# Altium schematic sheet RELE.SchDoc: ИЛ1429ТО1/1
size 410 x 297 mm; ApprovedBy: Стерхов В.Д.; CheckedBy: Стерхов В.Д.; Author: Сергеев Д.А.; CompanyName: ГК "СНАБЖЕНИЕ"; DrawnBy: Сергеев Д.А.; Engineer: Сергеев Д.А.; Organization: ГК "СНАБЖЕНИЕ"; DocumentNumber: ИЛ1429ТО1/1; Revision: 1; SheetNumber: 2; SheetTotal: 3
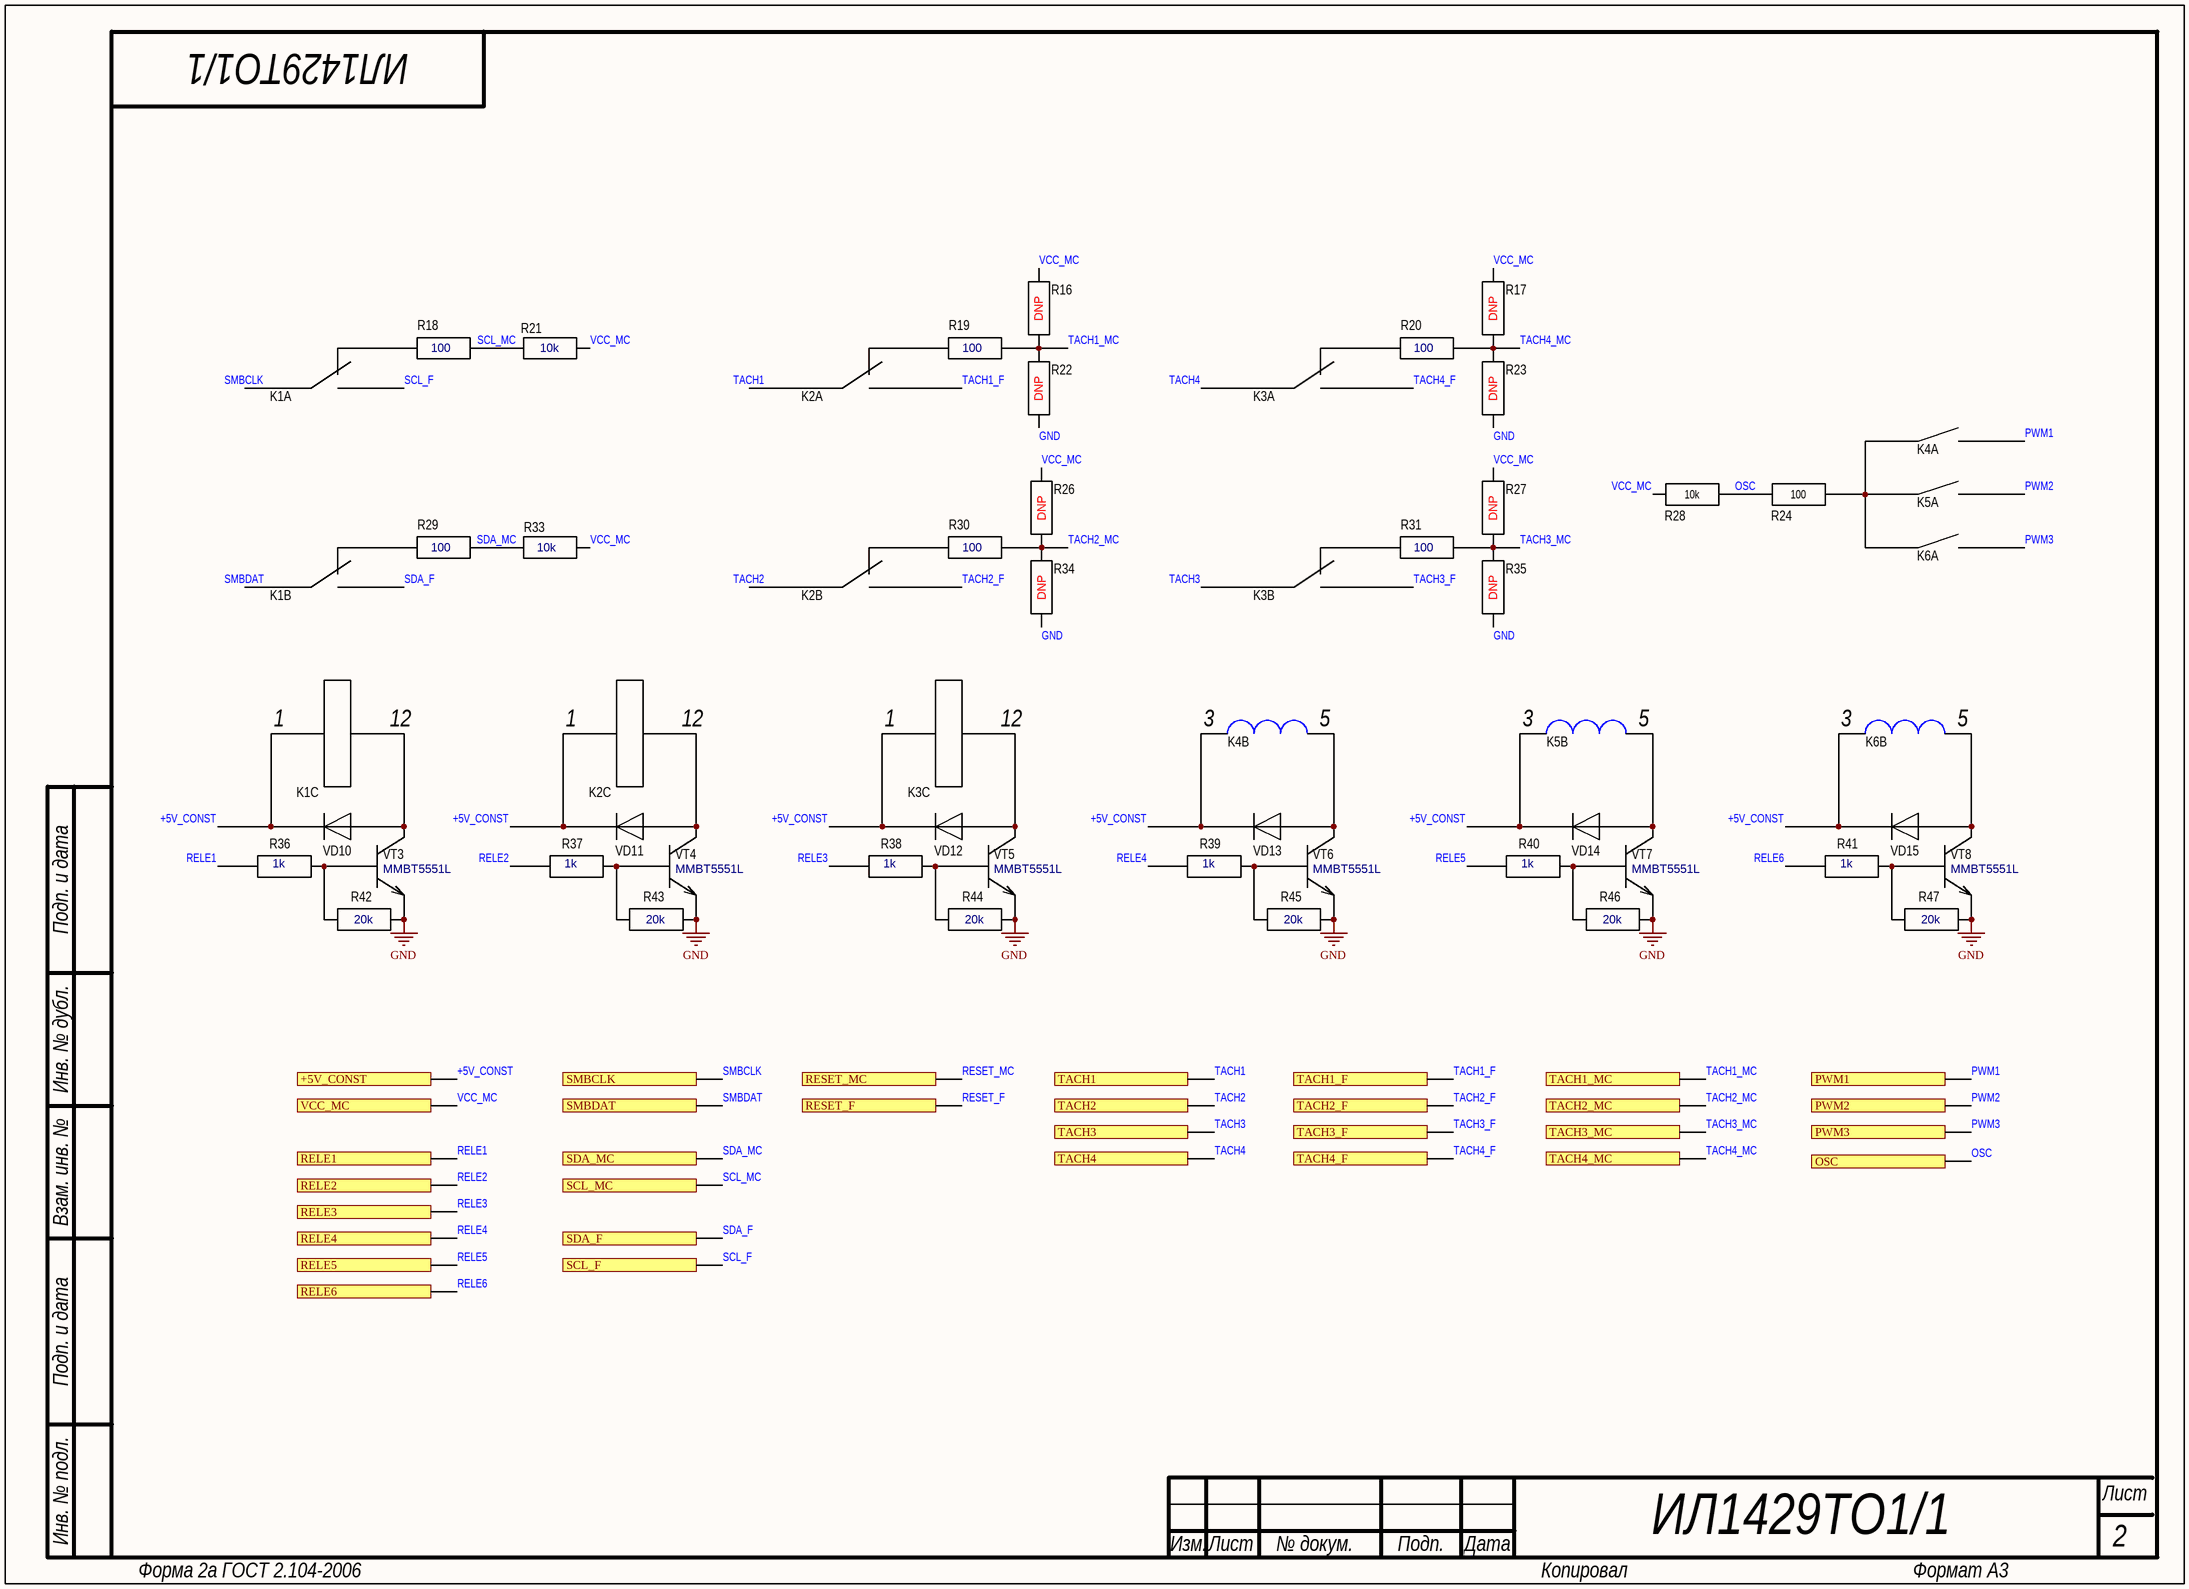
[diagram p0: RELE.SchDoc]

## Parts
K1  V23079A1001B301 TE  [V23079A1001B301]  (value not drawn)  (parts A,B,C of 3)
K2  V23079A1001B301 TE  [V23079A1001B301]  (value not drawn)  (parts A,B,C of 3)
K3  V23079A1001B301 TE  [V23079A1001B301]  (value not drawn)  (parts A,B,C of 3)
K4  TRR1A05F00  [TRR1A05F00]  (value not drawn)  (parts A,B of 2)
K5  TRR1A05F00  [TRR1A05F00]  (value not drawn)  (parts A,B of 2)
K6  TRR1A05F00  [TRR1A05F00]  (value not drawn)  (parts A,B of 2)
R16  DNP  [0805]
R17  DNP  [0805]
R18  100  [0805]
R19  100  [0805]
R20  100  [0805]
R21  10k  [0805]
R22  DNP  [0805]
R23  DNP  [0805]
R24  100  [0603]
R26  DNP  [0805]
R27  DNP  [0805]
R28  10k  [0603]
R29  100  [0805]
R30  100  [0805]
R31  100  [0805]
R33  10k  [0805]
R34  DNP  [0805]
R35  DNP  [0805]
R36  1k  [0805]
R37  1k  [0805]
R38  1k  [0805]
R39  1k  [0805]
R40  1k  [0805]
R41  1k  [0805]
R42  20k  [0805]
R43  20k  [0805]
R44  20k  [0805]
R45  20k  [0805]
R46  20k  [0805]
R47  20k  [0805]
VD10  LL4148 NXP  [SOD80C]  (value not drawn)
VD11  LL4148 NXP  [SOD80C]  (value not drawn)
VD12  LL4148 NXP  [SOD80C]  (value not drawn)
VD13  LL4148 NXP  [SOD80C]  (value not drawn)
VD14  LL4148 NXP  [SOD80C]  (value not drawn)
VD15  LL4148 NXP  [SOD80C]  (value not drawn)
VT3  MMBT5551L  [SOT-23]
VT4  MMBT5551L  [SOT-23]
VT5  MMBT5551L  [SOT-23]
VT6  MMBT5551L  [SOT-23]
VT7  MMBT5551L  [SOT-23]
VT8  MMBT5551L  [SOT-23]

## Ports
+5V_CONST, OSC, PWM1, PWM2, PWM3, RELE1, RELE2, RELE3, RELE4, RELE5, RELE6, RESET_F, RESET_MC, SCL_F, SCL_MC, SDA_F, SDA_MC, SMBCLK, SMBDAT, TACH1, TACH1_F, TACH1_MC, TACH2, TACH2_F, TACH2_MC, TACH3, TACH3_F, TACH3_MC, TACH4, TACH4_F, TACH4_MC, VCC_MC

## Nets
GND: R22.1 R23.1 R34.1 R35.1 R42.2 R43.2 R44.2 R45.2 R46.2 R47.2 VT3.2(E) VT4.2(E) VT5.2(E) VT6.2(E) VT7.2(E) VT8.2(E)
+5V_CONST: K1.1 K2.1 K3.1 K4.3 K5.3 K6.3 VD10.2(K) VD11.2(K) VD12.2(K) VD13.2(K) VD14.2(K) VD15.2(K) ; port +5V_CONST
OSC: R24.1 R28.2 ; port OSC
PWM1: K4.7 ; port PWM1
PWM2: K5.7 ; port PWM2
PWM3: K6.7 ; port PWM3
RELE1: R36.1 ; port RELE1
RELE2: R37.1 ; port RELE2
RELE3: R38.1 ; port RELE3
RELE4: R39.1 ; port RELE4
RELE5: R40.1 ; port RELE5
RELE6: R41.1 ; port RELE6
RESET_F: port RESET_F
RESET_MC: port RESET_MC
SCL_F: K1.5 ; port SCL_F
SCL_MC: R18.2 R21.1 ; port SCL_MC
SDA_F: K1.8 ; port SDA_F
SDA_MC: R29.2 R33.1 ; port SDA_MC
SMBCLK: K1.4 ; port SMBCLK
SMBDAT: K1.9 ; port SMBDAT
TACH1: K2.4 ; port TACH1
TACH1_F: K2.5 ; port TACH1_F
TACH1_MC: R16.1 R19.2 R22.2 ; port TACH1_MC
TACH2: K2.9 ; port TACH2
TACH2_F: K2.8 ; port TACH2_F
TACH2_MC: R26.1 R30.2 R34.2 ; port TACH2_MC
TACH3: K3.9 ; port TACH3
TACH3_F: K3.8 ; port TACH3_F
TACH3_MC: R27.1 R31.2 R35.2 ; port TACH3_MC
TACH4: K3.4 ; port TACH4
TACH4_F: K3.5 ; port TACH4_F
TACH4_MC: R17.1 R20.2 R23.2 ; port TACH4_MC
VCC_MC: R16.2 R17.2 R21.2 R26.2 R27.2 R28.1 R33.2 ; port VCC_MC
NetK1_3: K1.3 R18.1
NetK1_10: K1.10 R29.1
NetK1_12: K1.12 VD10.1(A) VT3.3(K)
NetK2_3: K2.3 R19.1
NetK2_10: K2.10 R30.1
NetK2_12: K2.12 VD11.1(A) VT4.3(K)
NetK3_3: K3.3 R20.1
NetK3_10: K3.10 R31.1
NetK3_12: K3.12 VD12.1(A) VT5.3(K)
NetK4_1: K4.1 K5.1 K6.1 R24.2
NetK4_5: K4.5 VD13.1(A) VT6.3(K)
NetK5_5: K5.5 VD14.1(A) VT7.3(K)
NetK6_5: K6.5 VD15.1(A) VT8.3(K)
NetR36_2: R36.2 R42.1 VT3.1(B)
NetR37_2: R37.2 R43.1 VT4.1(B)
NetR38_2: R38.2 R44.1 VT5.1(B)
NetR39_2: R39.2 R45.1 VT6.1(B)
NetR40_2: R40.2 R46.1 VT7.1(B)
NetR41_2: R41.2 R47.1 VT8.1(B)

## Notes on the sheet
- Подп. и дата
- Инв. № дубл.
- Взам. инв. №
- Инв. № подл.
- Изм.
- Лист
- № докум.
- Подп.
- Дата
- Форма 2а ГОСТ 2.104-2006
- Копировал
- Формат А3

## Library data of the parts
R16-R23 R26 R27 R29-R31 R33-R47 = R0805 Yageo: ComponentHeigt: 0.6; Firme: Yageo; Leadform: SMD; Kind: Резистор; ClassName: *; ComponentWeigt: *; Component Link: *; Packaging: 0805; NN: *; Value: *
R24 R28 = R0603 Yageo: ComponentHeigt: 0.5; Leadform: SMD; Firme: Yageo; Kind: Резистор; Packaging: 0402; ClassName: *; Component Link: *; NN: *
VD10-VD15 = LL4148 NXP: ComponentHeigt: 1.6; Leadform: SMD; NN: 24009301; KIND: Диод LL4148 NXP; Component Link: http://www.nxp.com; Packaging: SOD-80C; ClassName: *; Firme: NXP
VT3-VT8 = MMBT5551L: ComponentHeigt: 1.1; Firme: ONS; Leadform: SMD; NN: 24007468; KIND: Транзистор MMBT5551L*G ONS; ClassName: *; ComponentWeigt: *; Packaging: SOT-23